# EAGLE board NanoBot-REV2 (EAGLE 9.6.2), part 1 of 2
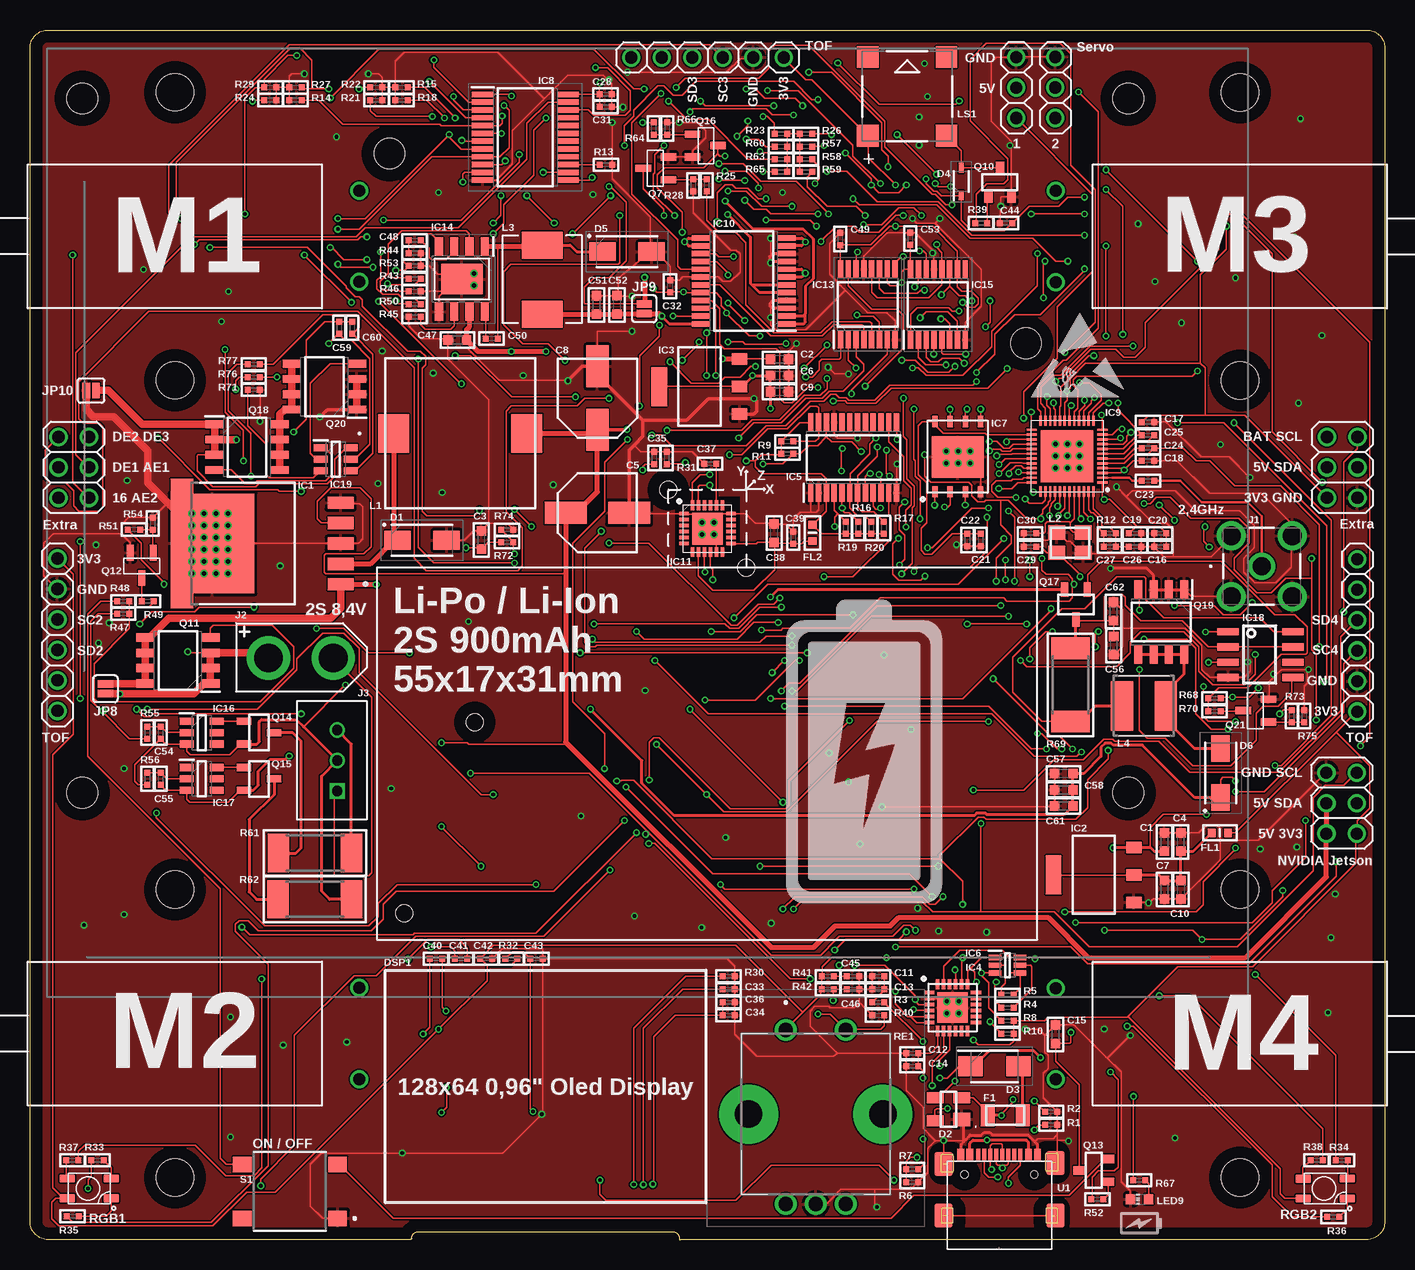
[diagram p3: board, top side]
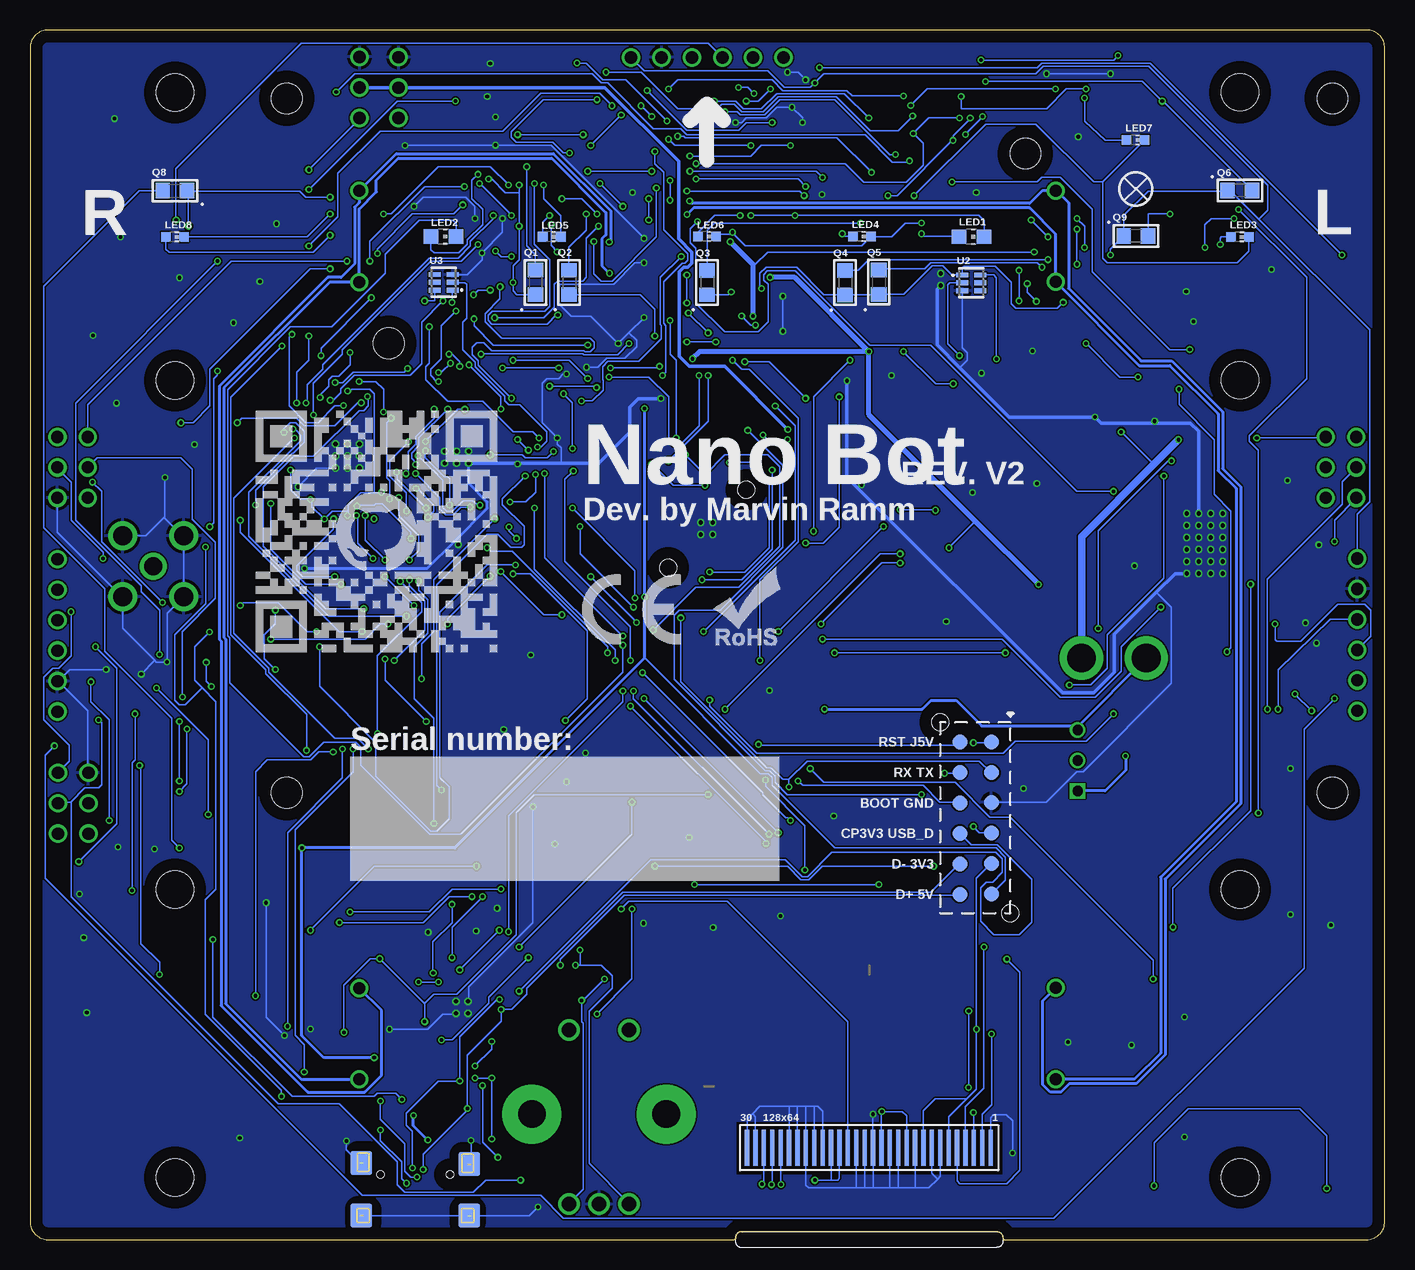
[diagram p4: board, bottom side, seen from below]

Size 112.9 x 100.8 mm. Coordinates in mm from the lower left corner, seen from the top.
Outline: 0,1.5 0,99.3 arc-90 1.5,100.8 111.4,100.8 arc-90 112.9,99.3 112.9,1.5 arc-90 111.4,0 54.2,0 arc-90 54.1,0.1 54.1,0.15 arc90 53.6,0.65 32.35,0.65 arc90 31.8,0.1 arc-90 31.7,0 1.5,0 arc-90 0,1.5
Copper layers (1*16): Top 0.035mm / dielectric 1.53mm / Bottom 0.035mm
Design rules "JLCPCB_1-2layer": minimum track width 5mil, minimum drill 0.3mm, track to track 5mil, track to pad 0.2mm, pad to pad 7mil, via to via 7mil, smd to smd 7mil, copper to edge 40mil, drill to drill 6mil, minimum pad ring 6mil, minimum via ring 0.13mm, stop-mask expansion 0.1mm, vias tented up to drill 20mil, thermal gap 10mil
Holes 2.55 mm at 29.95,90.5 83,74.7
Holes 1.4 mm at 59.7,56 53.2,62.5 37.05,43.1 31.2,27.2
tRestrict: area 53.8,56.5 to 59.2,61.9; area 83.5,62.6 to 89.3,68; area 62.2,81.2 to 63.8,82.4; area 62.2,77.4 to 63.8,78.5; area 65.1,62 to 65.7,62.5; area 48.2,94.7 to 48.7,95.2; area 20.4,94.8 to 21.6,96.2; area 20.4,95 to 21.8,96.2; area 29.2,95.1 to 29.6,96; area 30.2,95.1 to 30.6,95.9; area 29.3,95.9 to 30.3,96.2; area 29.5,94.8 to 30.2,95.2; 2 more areas
bRestrict: area 31.9,5.4 to 54,9.8
vRestrict: area 53.2,56 to 59.8,62.5

## Footprints (pad centres in the part's own frame; a part is rotated, then mirrored left to right if it is on the bottom)
C0603 = smd 0.8 x 0.8: 1 -0.762,0; 2 0.762,0
CAPAE660X800N = smd 3.5 x 1.85: 1 -2.65,0; 2 2.65,0
C0402 = smd 0.5 x 0.5: 1 -0.508,0; 2 0.508,0
DIOM5026X262N = smd 2.2 x 1.55: 1 -2.05,0; 2 2.05,0
SP0503BAHTG = smd 1.1 x 1.4: 1 -0.85,-1.1 | smd 0.9 x 1.4: 2 0.95,-1.1; 3 0.95,1.1; 4 -0.95,1.1
SODFL5026X120N = smd 2.02 x 1.67: 1 -2,0; 2 2,0
SODFL2512X90N = smd 0.82 x 0.42: 1 -1.15,0; 2 1.15,0
2864KSWE_128X64I2C = smd 0.35 x 3: D1 0.175,1.5; D2 0.875,1.5; D3 1.575,1.5; D4 2.275,1.5; D5 2.975,1.5; D6 3.675,1.5; D7 4.375,1.5; D8 5.075,1.5; D9 5.775,1.5; D10 6.475,1.5; D11 7.175,1.5; D12 7.875,1.5; D13 8.575,1.5; D14 9.275,1.5; D15 9.975,1.5; D16 10.675,1.5; D17 11.375,1.5; D18 12.075,1.5; D19 12.775,1.5; D20 13.475,1.5; D21 14.175,1.5; D22 14.875,1.5; D23 15.575,1.5; D24 16.275,1.5; D25 16.975,1.5; D26 17.675,1.5; D27 18.375,1.5; D28 19.075,1.5; D29 19.775,1.5; D30 20.475,1.5
FUSC3216X82N = smd 1.16 x 1.81: 1 -1.475,0; 2 1.475,0
BLM18AG102BH1D = smd 0.65 x 0.7: 1 -0.675,0; 2 0.675,0
KTT0005B = smd 2.16 x 1.02: 1 12.461,-3.4; 2 12.461,-1.7; 3 12.461,0; 4 12.461,1.7; 5 12.461,3.4 | smd 6.99 x 8.33: 6 1.786,0 | smd 1.91 x 1.235: 7 -0.754,4.782; 8 -0.754,-4.782
SOT229P700X180-4N = smd 1.3 x 0.95: 1 -3.35,2.29; 2 -3.35,0; 3 -3.35,-2.29 | smd 1.3 x 3.25: 4 3.35,0
QFN50P400X400X80-25N = smd 0.85 x 0.3: 1 -1.95,1.25; 2 -1.95,0.75; 3 -1.95,0.25; 4 -1.95,-0.25; 5 -1.95,-0.75; 6 -1.95,-1.25; 13 1.95,-1.25; 14 1.95,-0.75; 15 1.95,-0.25; 16 1.95,0.25; 17 1.95,0.75; 18 1.95,1.25 | smd 0.3 x 0.85: 7 -1.25,-1.95; 8 -0.75,-1.95; 9 -0.25,-1.95; 10 0.25,-1.95; 11 0.75,-1.95; 12 1.25,-1.95; 19 1.25,1.95; 20 0.75,1.95; 21 0.25,1.95; 22 -0.25,1.95; 23 -0.75,1.95; 24 -1.25,1.95 | smd 2.55 x 2.55: 25 0,0
SOP65P640X120-24N = smd 1.475 x 0.45: 1 -2.938,3.575; 2 -2.938,2.925; 3 -2.938,2.275; 4 -2.938,1.625; 5 -2.938,0.975; 6 -2.938,0.325; 7 -2.938,-0.325; 8 -2.938,-0.975; 9 -2.938,-1.625; 10 -2.938,-2.275; 11 -2.938,-2.925; 12 -2.938,-3.575; 13 2.938,-3.575; 14 2.938,-2.925; 15 2.938,-2.275; 16 2.938,-1.625; 17 2.938,-0.975; 18 2.938,-0.325; 19 2.938,0.325; 20 2.938,0.975; 21 2.938,1.625; 22 2.938,2.275; 23 2.938,2.925; 24 2.938,3.575
SOT65P230X120-6N = smd 1.05 x 0.45: 1 -1.05,0.65; 2 -1.05,0; 3 -1.05,-0.65; 4 1.05,-0.65; 5 1.05,0; 6 1.05,0.65
SON127P800X600X80-9N = smd 0.95 x 0.45: 1 -2.85,1.905; 2 -2.85,0.635; 3 -2.85,-0.635; 4 -2.85,-1.905; 5 3,-1.905; 6 3,-0.635; 7 3,0.635; 8 3,1.905 | smd 3.45 x 4.35: 9 0.05,0
SOP65P780X200-24N = smd 1.8 x 0.45: 1 -3.55,3.575; 2 -3.55,2.925; 3 -3.55,2.275; 4 -3.55,1.625; 5 -3.55,0.975; 6 -3.55,0.325; 7 -3.55,-0.325; 8 -3.55,-0.975; 9 -3.55,-1.625; 10 -3.55,-2.275; 11 -3.55,-2.925; 12 -3.55,-3.575; 13 3.55,-3.575; 14 3.55,-2.925; 15 3.55,-2.275; 16 3.55,-1.625; 17 3.55,-0.975; 18 3.55,-0.325; 19 3.55,0.325; 20 3.55,0.975; 21 3.55,1.625; 22 3.55,2.275; 23 3.55,2.925; 24 3.55,3.575
QFN40P600X600X90-49N = smd 0.85 x 0.2: 1 -2.95,2.2; 2 -2.95,1.8; 3 -2.95,1.4; 4 -2.95,1; 5 -2.95,0.6; 6 -2.95,0.2; 7 -2.95,-0.2; 8 -2.95,-0.6; 9 -2.95,-1; 10 -2.95,-1.4; 11 -2.95,-1.8; 12 -2.95,-2.2; 25 2.95,-2.2; 26 2.95,-1.8; 27 2.95,-1.4; 28 2.95,-1; 29 2.95,-0.6; 30 2.95,-0.2; 31 2.95,0.2; 32 2.95,0.6; 33 2.95,1; 34 2.95,1.4; 35 2.95,1.8; 36 2.95,2.2 | smd 0.2 x 0.85: 13 -2.2,-2.95; 14 -1.8,-2.95; 15 -1.4,-2.95; 16 -1,-2.95; 17 -0.6,-2.95; 18 -0.2,-2.95; 19 0.2,-2.95; 20 0.6,-2.95; 21 1,-2.95; 22 1.4,-2.95; 23 1.8,-2.95; 24 2.2,-2.95; 37 2.2,2.95; 38 1.8,2.95; 39 1.4,2.95; 40 1,2.95; 41 0.6,2.95; 42 0.2,2.95; 43 -0.2,2.95; 44 -0.6,2.95; 45 -1,2.95; 46 -1.4,2.95; 47 -1.8,2.95; 48 -2.2,2.95 | smd 4.35 x 4.35: 49 0,0
SOP65P760X160-24N = smd 1.525 x 0.45: 1 -3.562,3.575; 2 -3.562,2.925; 3 -3.562,2.275; 4 -3.562,1.625; 5 -3.562,0.975; 6 -3.562,0.325; 7 -3.562,-0.325; 8 -3.562,-0.975; 9 -3.562,-1.625; 10 -3.562,-2.275; 11 -3.562,-2.925; 12 -3.562,-3.575; 13 3.562,-3.575; 14 3.562,-2.925; 15 3.562,-2.275; 16 3.562,-1.625; 17 3.562,-0.975; 18 3.562,-0.325; 19 3.562,0.325; 20 3.562,0.975; 21 3.562,1.625; 22 3.562,2.275; 23 3.562,2.925; 24 3.562,3.575
QFN50P400X400X95-25N = smd 0.8 x 0.3: 1 -1.95,1.25; 2 -1.95,0.75; 3 -1.95,0.25; 4 -1.95,-0.25; 5 -1.95,-0.75; 6 -1.95,-1.25; 13 1.95,-1.25; 14 1.95,-0.75; 15 1.95,-0.25; 16 1.95,0.25; 17 1.95,0.75; 18 1.95,1.25 | smd 0.3 x 0.8: 7 -1.25,-1.95; 8 -0.75,-1.95; 9 -0.25,-1.95; 10 0.25,-1.95; 11 0.75,-1.95; 12 1.25,-1.95; 19 1.25,1.95; 20 0.75,1.95; 21 0.25,1.95; 22 -0.25,1.95; 23 -0.75,1.95; 24 -1.25,1.95 | smd 2.55 x 2.65: 25 0,0
SOP65P640X110-16N = smd 1.475 x 0.45: 1 -2.938,2.275; 2 -2.938,1.625; 3 -2.938,0.975; 4 -2.938,0.325; 5 -2.938,-0.325; 6 -2.938,-0.975; 7 -2.938,-1.625; 8 -2.938,-2.275; 9 2.938,-2.275; 10 2.938,-1.625; 11 2.938,-0.975; 12 2.938,-0.325; 13 2.938,0.325; 14 2.938,0.975; 15 2.938,1.625; 16 2.938,2.275
SOIC127P600X170-9N = smd 1.525 x 0.7: 1 -2.712,1.905; 2 -2.712,0.635; 3 -2.712,-0.635; 4 -2.712,-1.905; 5 2.712,-1.905; 6 2.712,-0.635; 7 2.712,0.635; 8 2.712,1.905 | smd 2.56 x 3.45: 9 0,0
SOT95P280X140-6N = smd 1.15 x 0.6: 1 -1.25,0.95; 2 -1.25,0; 3 -1.25,-0.95; 4 1.25,-0.95; 5 1.25,0; 6 1.25,0.95
CN3302 = smd 0.6 x 1.8: 1 0.49,-0.79; 2 1.76,-0.79; 3 3.03,-0.79; 4 4.3,-0.79; 5 4.3,4.61; 6 3.03,4.61; 7 1.76,4.61; 8 0.49,4.61
518148322 = drill 1.5 pad 2.25: 1 0,0 | drill 1.6 pad 2.4: 2 -2.54,-2.54; 3 2.54,-2.54; 4 2.54,2.54; 5 -2.54,2.54
XT_30 = drill 2.4 pad 3.6: B+ 0,0; GND 5.4,0
2SBALANCER = drill 0.85: 1S 2.64,0; 2S 5.18,0 | drill 0.85 square: GND 0.1,0
2X03 = drill 1.016: 1 -2.54,-1.27; 2 -2.54,1.27; 3 0,-1.27; 4 0,1.27; 5 2.54,-1.27; 6 2.54,1.27
1X06 = drill 1.016: 1 -6.35,0; 2 -3.81,0; 3 -1.27,0; 4 1.27,0; 5 3.81,0; 6 6.35,0
1X03 = drill 1.016: 1 -2.54,0; 2 0,0; 3 2.54,0
SMT-JUMPER_2_NO_SILK = smd 0.635 x 1.27: 1 -0.406,0; 2 0.406,0
SLF12575 = smd 2.6 x 3.2: 1 -5.55,0; 2 5.55,0
SMD3225_4P16MHZ20PF10PPM4085 = smd 1.4 x 1.2: 1 -1.1,-0.85; 2 1.1,-0.85; 3 1.1,0.85; 4 -1.1,0.85
MDA7050-4R7M = smd 2.25 x 3.4: 1 0.8,3.3; 2 6.55,3.3
LQH5BPB100MT0L = smd 1.85 x 4.1: 1 -1.825,0; 2 1.825,0
CHIP-LED0805 = smd 1.2 x 1.2: A 0,-1.05; C 0,1.05
CHIP-LED0603 = smd 0.8 x 0.8: A 0,-0.75; C 0,0.75
XDCR_CMT-7525-80-SMT-TR = smd 1.8 x 1.8: 1 3.275,3.275; 2 3.275,-3.275; N -3.275,-3.275; P -3.275,3.275
MOTOR_30RPM = drill 1: 1 2.2,3.1; 2 9.8,3.1 | hole 3.1: -6,-12.25; 18,-12.25
0805 = smd 1.2 x 1.3: 1 -1.016,0; 2 1.016,0
SOT95P237X112-3N = smd 1.3 x 0.6: 1 -1.05,0.95; 2 -1.05,-0.95; 3 1.05,0
SOT95P240X120-3N = smd 1 x 0.7: 1 -1.2,0.95; 2 -1.2,-0.95; 3 1.2,0
SOIC127P600X175-8N = smd 1.525 x 0.7: 1 -2.712,1.905; 2 -2.712,0.635; 3 -2.712,-0.635; 4 -2.712,-1.905; 5 2.712,-1.905; 6 2.712,-0.635; 7 2.712,0.635; 8 2.712,1.905
FSS2302SA2SHB = smd 1.2 x 0.6: D 1.25,0; G -1.25,0.95; S -1.25,-0.95
SOT95P280X125-3N = smd 1.2 x 0.6: 1 -1.25,0.95; 2 -1.25,-0.95; 3 1.25,0
SOIC127P600X175-8N' = smd 1.525 x 0.65: 1 -2.712,1.905; 2 -2.712,0.635; 3 -2.712,-0.635; 4 -2.712,-1.905; 5 2.712,-1.905; 6 2.712,-0.635; 7 2.712,0.635; 8 2.712,1.905
R0402 = smd 0.5 x 0.5: 1 -0.508,0; 2 0.508,0
R2512 = smd 1.8 x 3.2: 1 -3.048,0; 2 3.048,0
PEC12R4230FS0024 = drill 1.2 pad 1.8: 1 0,0; 2 5,0; A1 0,-14.5; B1 5,-14.5; C1 2.5,-14.5 | drill 2.3 pad 4.92: MH1 -3.1,-7; MH2 8.1,-7
RGBLED = smd 0.686 x 1.3: +5V -1.456,1.996; P1 0.184,1.996; P2 -1.458,-1.678; P3 0.192,-1.678
B3S1002P = smd 1.55 x 1.3: 1 3.975,-2.25; 2 -3.975,-2.25; 3 3.975,2.25; 4 -3.975,2.25
PAD.03X.05 = smd 1.27 x 1.27: 1 0,0
TYPE-C-31-M-14_HRO = smd 0.559 x 1.092: A1B12 -3.11,4; A4B9 -2.36,4; B1A12 3.29,4; B4A9 2.54,4 | smd 0.305 x 1.092: A5 -1.16,4; A6 -0.16,4; A7 0.34,4; A8 1.34,4; B5 1.84,4; B6 0.84,4; B7 -0.66,4; B8 -1.66,4 | smd 1.5 x 2 bottom: P$1 -4.24,3.26; P$2 4.46,3.36; P$3 -4.44,3.26; P$4 4.66,3.36; P$5 -4.24,-1.04; P$6 -4.44,-1.04; P$7 4.46,-1.04; P$8 4.66,-1.04; P$9 -4.54,3.26; P$10 -4.54,-1.04; P$11 4.76,-1.04; P$12 4.76,3.36 | smd 1.5 x 2: P$14 -4.54,3.26; P$16 -4.54,-1.04; P$18 4.76,3.36; P$20 4.76,-1.04 | hole 0.6: -2.79,2.39; 3.01,2.39
FN_1 = smd 1 x 0.4: 1 -0.75,0.65; 2 -0.75,0; 3 -0.75,-0.65; 4 0.75,-0.65; 5 0.75,0; 6 0.75,0.65
JETSON_NANO = hole 2.55: 2.95,-4.15; 90.1,-4.15; 2.95,-62; 90.1,-62

## Placement (x,y rotation side)
C1  4,7µF  [C0603]  94.54,33.13 90 top
C2  4,7µF  [C0603]  62.46,73.36 0 top
C3  10µF  [C0603]  37.61,58.3 270 top
C4  10µF  [C0603]  95.9,33.13 90 top
C5  UUD1C151MCL1GS  [CAPAE660X800N]  47.28,60.56 0 top
C6  10µF  [C0603]  62.46,72 0 top
C7  10µF  [C0603]  94.55,29.16 270 top
C8  UUD1C151MCL1GS  [CAPAE660X800N]  47.29,70.12 90 top
C9  10µF  [C0603]  62.46,70.65 0 top
C10  10µF  [C0603]  95.91,29.16 270 top
C11  0,1uF  [C0402]  70.68,21.94 0 top
C12  0,1uF  [C0402]  73.52,15.54 0 top
C13  4,7uF  [C0402]  70.67,20.85 0 top
C14  4,7uF  [C0402]  73.52,14.44 0 top
C15  10µF  [C0603]  85.46,17.11 270 top
C16  100pF  [C0402]  94.18,57.75 0 top
C17  0,1uF  [C0402]  93.16,68.13 180 top
C18  0,1uF  [C0402]  93.16,64.9 180 top
C19  0,1uF  [C0402]  92.09,58.86 180 top
C20  0,1uF  [C0402]  94.18,58.86 0 top
C21  1uF  [C0402]  79.23,58.3 90 top
C22  0,1uF  [C0402]  78.12,58.3 90 top
C23  5,6pF  [C0402]  93.16,63.24 0 top
C24  270pF  [C0402]  93.16,65.96 180 top
C25  270pF  [C0402]  93.16,67.04 0 top
C26  10nF  [C0402]  92.09,57.75 180 top
C27  3nF  [C0402]  89.98,57.75 180 top
C28  0,1µF  [C0402]  47.97,95.44 0 top
C29  12pF  [C0402]  83.33,57.74 0 top
C30  12pF  [C0402]  83.33,58.85 0 top
C31  1uF  [C0402]  47.97,94.39 180 top
C32  100nF  [C0402]  53.34,79.45 90 top
C33  1µF  [C0402]  58.22,20.87 180 top
C34  1µF  [C0402]  58.22,18.69 180 top
C35  100nF  [C0402]  52.03,65.13 270 top
C36  1µF  [C0402]  58.22,19.78 180 top
C37  10nF  [C0402]  56.68,64.66 180 top
C38  10µF  [C0603]  62.01,58.87 270 top
C39  1uF  [C0402]  63.6,58.5 90 top
C40  1µF  [C0402]  33.84,23.4 0 top
C41  1µF  [C0402]  35.92,23.4 0 top
C42  1µF  [C0402]  38.01,23.4 0 top
C43  1µF  [C0402]  42.21,23.4 0 top
C44  1uF  [C0402]  81.34,84.71 180 top
C45  10nF  [C0402]  68.59,21.94 0 top
C46  10nF  [C0402]  68.59,20.85 0 top
C47  10µF  [C0603]  35.62,74.96 0 top
C48  100pF  [C0402]  32.05,83.29 0 top
C49  0,1µF  [C0402]  67.51,83.38 90 top
C50  0,1µF  [C0402]  38.47,75.09 0 top
C51  10µF  [C0603]  47.21,77.89 270 top
C52  10µF  [C0603]  48.91,77.9 270 top
C53  0,1µF  [C0402]  73.36,83.41 90 top
C54  100nF  [C0402]  10.89,42.25 270 top
C55  100nF  [C0402]  10.89,38.4 270 top
C56  10µF  [C0603]  90.31,49.51 270 top
C57  10µF  [C0603]  86.14,38.83 180 top
C58  10µF  [C0603]  86.14,37.48 180 top
C59  0,1µF  [C0402]  25.77,75.99 90 top
C60  0,1µF  [C0402]  26.86,75.99 90 top
C61  10µF  [C0603]  86.14,36.14 180 top
C62  10µF  [C0603]  90.3,52.35 90 top
D1  SS34A  [DIOM5026X262N]  32.67,58.28 0 top
D2  SP0503BAHTG  [SP0503BAHTG]  76.54,10.86 90 top
D3  SK53AFL-TP  [SODFL5026X120N]  80.37,14.43 0 top
D4  1N4148WS  [SODFL2512X90N]  77.6,88.16 90 top
D5  SS34A  [DIOM5026X262N]  49.75,82.33 0 top
D6  SS34A  [DIOM5026X262N]  99.22,38.88 90 top
DSP1  2864KSWE_128X64I2C  [2864KSWE_128X64I2C]  53.32,6.16 0 bottom
F1  NANOSMDC020F-2  [FUSC3216X82N]  81.27,10.36 0 top
FL1  BLM18PG121SN1D  [BLM18AG102BH1D]  99.15,33.9 180 top
FL2  BLM18PG121SN1D  [BLM18AG102BH1D]  65.2,58.89 270 top
IC1  LM2576S-5.0  [KTT0005B]  13.42,58.01 0 top
IC2  AMS1117-3.3  [SOT229P700X180-4N]  88.64,30.39 180 top
IC3  AMS1117-3.3  [SOT229P700X180-4N]  55.79,71.09 180 top
IC4  CP2102N-A02-GQFN24R  [QFN50P400X400X80-25N]  76.89,19.34 0 top
IC5  TCA9548APWR  [SOP65P640X120-24N]  68.64,65.18 90 top
IC6  MMDT3904-TP  [SOT65P230X120-6N]  81.46,22.86 0 top
IC7  W25Q128JVPIQ  [SON127P800X600X80-9N]  77.31,65.17 90 top
IC8  CD74HC4067SM96  [SOP65P780X200-24N]  41.28,91.86 0 top
IC9  ESP32-D0WDQ6  [QFN40P600X600X90-49N]  86.42,65.29 180 top
IC10  TB6612FNG,C,8,EL  [SOP65P760X160-24N]  59.48,79.89 180 top
IC11  MPU-6050  [QFN50P400X400X95-25N]  56.45,59.25 0 top
IC13  74HC595PW,118  [SOP65P640X110-16N]  69.81,77.94 90 top
IC14  MP1584EN-LF-Z  [SOIC127P600X170-9N]  35.99,80.05 270 top
IC15  74HC595PW,118  [SOP65P640X110-16N]  75.66,77.93 90 top
IC16  HY2213-BB3A  [SOT95P280X140-6N]  14.3,42.25 0 top
IC17  HY2213-BB3A  [SOT95P280X140-6N]  14.3,38.4 0 top
IC18  CN3302  [CN3302]  100.63,51.15 270 top
IC19  HY2120-CB  [SOT95P280X140-6N]  25.47,65.03 0 top
J1  5-1814832-2  [518148322]  102.64,56.11 0 top
J2  XT_30  [XT_30]  19.87,48.47 0 top
J3  2SBALANCER  [2SBALANCER]  25.6,37.29 90 top
JP1  [2X03]  109.3,36.37 270 top
JP2  [1X06]  2.29,50.41 90 top
JP3  [1X06]  56.46,98.51 0 top
JP4  [1X06]  110.61,50.35 270 top
JP5  [1X03]  82.19,96 90 top
JP6  [1X03]  85.44,96.01 90 top
JP8  JUMPER-SMT_2_NO_SILK  [SMT-JUMPER_2_NO_SILK]  6.29,45.9 90 top
JP9  JUMPER-SMT_2_NO_SILK  [SMT-JUMPER_2_NO_SILK]  51.19,77.57 90 top
JP10  JUMPER-SMT_2_NO_SILK  [SMT-JUMPER_2_NO_SILK]  5.09,70.76 0 top
JP11  [2X03]  109.35,64.35 270 top
JP12  [2X03]  3.65,64.35 270 top
L1  SLF12575T-101M1R9-PF  [SLF12575]  35.85,67.18 0 top
L2  SMD-3225_4P16MHZ_20PF_10PPM_-4  [SMD3225_4P16MHZ20PF10PPM4085]  86.66,58.09 0 top
L3  MDA7050-4R7M  [MDA7050-4R7M]  39.38,83.68 270 top
L4  LQH5BPB100MT0L  [LQH5BPB100MT0L]  92.82,44.47 0 top
LED1  [CHIP-LED0805]  34.45,83.57 270 bottom
LED2  [CHIP-LED0805]  78.45,83.58 270 bottom
LED3  SZYY0603W  [CHIP-LED0603]  12.07,83.56 270 bottom
LED4  SZYY0603W  [CHIP-LED0603]  43.57,83.59 270 bottom
LED5  SZYY0603W  [CHIP-LED0603]  69.42,83.57 270 bottom
LED6  SZYY0603W  [CHIP-LED0603]  56.47,83.6 270 bottom
LED7  SZYY0603W  [CHIP-LED0603]  20.77,91.63 270 bottom
LED8  SZYY0603W  [CHIP-LED0603]  100.82,83.56 270 bottom
LED9  SZYY0603W  [CHIP-LED0603]  92.47,3.36 90 top
LS1  CMT-7525-80-SMT-TR  [XDCR_CMT-7525-80-SMT-TR]  73.09,95.26 90 top
M1  MOTOR_30RPM  [MOTOR_30RPM]  24.33,23.17 270 top
M2  MOTOR_30RPM  [MOTOR_30RPM]  24.33,89.61 270 top
M3  MOTOR_30RPM  [MOTOR_30RPM]  88.57,77.6 90 top
M4  MOTOR_30RPM  [MOTOR_30RPM]  88.57,11.16 90 top
Q1  PT17-21C/L41/TR8  [0805]  70.77,79.77 270 bottom
Q2  PT17-21C/L41/TR8  [0805]  67.97,79.76 270 bottom
Q3  PT17-21C/L41/TR8  [0805]  56.47,79.75 270 bottom
Q4  PT17-21C/L41/TR8  [0805]  44.97,79.74 270 bottom
Q5  PT17-21C/L41/TR8  [0805]  42.17,79.78 270 bottom
Q6  PT17-21C/L41/TR8  [0805]  12.08,87.42 180 bottom
Q7  SI2302DDS-T1-GE3  [SOT95P237X112-3N]  52.15,89.27 180 top
Q8  PT17-21C/L41/TR8  [0805]  100.82,87.41 0 bottom
Q9  PT17-21C/L41/TR8  [0805]  20.74,83.64 180 bottom
Q10  MMBT3904  [SOT95P240X120-3N]  80.83,88.11 90 top
Q11  IRF7416TRPBF  [SOIC127P600X175-8N]  12.32,48.26 180 top
Q12  SI2302DDS-T1-GE3  [SOT95P237X112-3N]  9.31,56.19 270 top
Q13  MMBT3904  [SOT95P240X120-3N]  88.64,5.77 180 top
Q14  FSS2302SA2SHB  [FSS2302SA2SHB]  19.09,42.25 0 top
Q15  FSS2302SA2SHB  [FSS2302SA2SHB]  19.09,38.4 0 top
Q16  SI2302DDS-T1-GE3  [SOT95P237X112-3N]  56.27,91.17 0 top
Q17  AO3407A  [SOT95P280X125-3N]  87.16,52.92 270 top
Q18  AO4406AL  [SOIC127P600X175-8N']  18.09,66.04 0 top
Q19  AO4468  [SOIC127P600X175-8N']  94.27,51.46 270 top
Q20  AO4406AL  [SOIC127P600X175-8N']  24.53,71.08 180 top
Q21  SI2302DDS-T1-GE3  [SOT95P237X112-3N]  102.15,44.09 180 top
R1  5,1kΩ  [R0402]  85.1,9.57 0 top
R2  5,1kΩ  [R0402]  85.1,10.65 0 top
R3  2,2kΩ  [R0402]  70.67,19.77 0 top
R4  10kΩ  [R0402]  81.46,19.33 0 top
R5  10kΩ  [R0402]  81.46,20.41 0 top
R6  33kΩ  [R0402]  73.52,4.79 0 top
R7  22kΩ  [R0402]  73.52,5.88 180 top
R8  10kΩ  [R0402]  81.46,18.24 180 top
R9  10kΩ  [R0402]  63.11,66.51 180 top
R10  10kΩ  [R0402]  81.46,17.16 0 top
R11  10kΩ  [R0402]  63.11,65.48 180 top
R12  20kΩ  [R0402]  89.98,58.86 0 top
R13  10kΩ  [R0402]  48,89.57 0 top
R14  5,1kΩ  [R0402]  22.12,94.96 180 top
R15  5,1kΩ  [R0402]  30.96,96.01 180 top
R16  10kΩ  [R0402]  69.03,59.31 90 top
R17  10kΩ  [R0402]  71.16,59.31 90 top
R18  5,1kΩ  [R0402]  30.96,94.94 180 top
R19  10kΩ  [R0402]  67.97,59.31 270 top
R20  10kΩ  [R0402]  70.1,59.31 270 top
R21  5,1kΩ  [R0402]  28.86,94.94 0 top
R22  5,1kΩ  [R0402]  28.86,96.01 0 top
R23  100Ω  [R0402]  62.58,92.15 180 top
R24  5,1kΩ  [R0402]  20.03,94.96 0 top
R25  1kΩ  [R0402]  56.39,87.86 90 top
R26  100Ω  [R0402]  64.67,92.15 0 top
R27  5,1kΩ  [R0402]  22.12,96.01 180 top
R28  100kΩ  [R0402]  55.27,87.85 270 top
R29  2,2kΩ  [R0402]  20.03,96.01 0 top
R30  390kΩ  [R0402]  58.22,21.95 0 top
R31  10kΩ  [R0402]  53.07,65.13 270 top
R32  10kΩ  [R0402]  40.11,23.4 0 top
R33  2,2kΩ  [R0402]  5.63,6.61 180 top
R34  2,2kΩ  [R0402]  109.32,6.61 180 top
R35  2,2kΩ  [R0402]  3.55,1.94 180 top
R36  2,2kΩ  [R0402]  108.61,1.89 180 top
R37  2,2kΩ  [R0402]  3.53,6.61 0 top
R38  2,2kΩ  [R0402]  107.22,6.61 0 top
R39  1kΩ  [R0402]  79.26,84.71 0 top
R40  10kΩ  [R0402]  70.67,18.68 0 top
R41  10kΩ  [R0402]  66.49,21.94 0 top
R42  10kΩ  [R0402]  66.49,20.85 0 top
R43  100kΩ  [R0402]  32.05,80.08 0 top
R44  100kΩ  [R0402]  32.05,82.21 0 top
R45  100kΩ  [R0402]  32.05,76.89 180 top
R46  100kΩ  [R0402]  32.05,79.01 180 top
R47  100kΩ  [R0402]  7.77,52.15 0 top
R48  1kΩ  [R0402]  7.77,53.2 180 top
R49  1kΩ  [R0402]  9.82,53.2 180 top
R50  10kΩ  [R0402]  32.05,77.95 0 top
R51  1kΩ  [R0402]  8.66,59.17 0 top
R52  1kΩ  [R0402]  88.95,3.37 0 top
R53  75kΩ  [R0402]  32.05,81.15 180 top
R54  100kΩ  [R0402]  10.23,59.66 90 top
R55  100Ω  [R0402]  9.79,42.25 90 top
R56  100Ω  [R0402]  9.79,38.4 90 top
R57  100Ω  [R0402]  64.67,91.09 0 top
R58  100Ω  [R0402]  64.67,90.03 0 top
R59  100Ω  [R0402]  64.67,88.97 0 top
R60  100Ω  [R0402]  62.58,91.09 180 top
R61  62Ω  [R2512]  23.74,32.21 0 top
R62  62Ω  [R2512]  23.73,28.36 0 top
R63  100Ω  [R0402]  62.58,90.03 180 top
R64  1kΩ  [R0402]  51.99,92.59 270 top
R65  100Ω  [R0402]  62.58,88.97 180 top
R66  100kΩ  [R0402]  53.11,92.59 90 top
R67  2,2kΩ  [R0402]  92.44,4.94 180 top
R68  100kΩ  [R0402]  98.71,45.1 180 top
R69  0,1Ω  [R2512]  86.71,46.23 270 top
R70  1kΩ  [R0402]  98.71,44.04 0 top
R71  2,2kΩ  [R0402]  18.65,70.81 0 top
R72  100kΩ  [R0402]  39.76,58.11 0 top
R73  1kΩ  [R0402]  105.15,43.62 270 top
R74  64,9kΩ  [R0402]  39.76,59.16 0 top
R75  100kΩ  [R0402]  106.2,43.62 90 top
R76  330Ω  [R0402]  18.65,71.87 0 top
R77  330Ω  [R0402]  18.65,72.95 180 top
RE1  PEC12R-4230F-S0024  [PEC12R4230FS0024]  62.98,17.46 0 top
RGB1  RGBLED  [RGBLED]  5.09,4.9 90 top
RGB2  RGBLED  [RGBLED]  108.09,4.89 90 top
S1  B3S-1002P  [B3S1002P]  21.66,4.02 0 top
TP1  TEST-POINT3X5  [PAD.03X.05]  32.78,28.82 270 bottom
TP2  TEST-POINT3X5  [PAD.03X.05]  32.78,31.36 270 bottom
TP3  TEST-POINT3X5  [PAD.03X.05]  32.78,33.9 270 bottom
TP4  TEST-POINT3X5  [PAD.03X.05]  32.78,36.44 270 bottom
TP5  TEST-POINT3X5  [PAD.03X.05]  35.42,28.77 270 bottom
TP6  TEST-POINT3X5  [PAD.03X.05]  35.42,31.31 270 bottom
TP7  TEST-POINT3X5  [PAD.03X.05]  35.42,33.85 270 bottom
TP8  TEST-POINT3X5  [PAD.03X.05]  35.42,36.39 270 bottom
TP9  TEST-POINT3X5  [PAD.03X.05]  35.42,38.93 270 bottom
TP10  TEST-POINT3X5  [PAD.03X.05]  35.42,41.47 270 bottom
TP11  TEST-POINT3X5  [PAD.03X.05]  32.77,38.91 270 bottom
TP12  TEST-POINT3X5  [PAD.03X.05]  32.77,41.45 270 bottom
U1  TYPE-C-31-M-14  [TYPE-C-31-M-14_HRO]  80.68,3.04 0 top
U2  TCS34725FN  [FN_1]  34.46,79.73 0 bottom
U3  TCS34725FN  [FN_1]  78.44,79.77 180 bottom
U$3  JETSON_NANO  [JETSON_NANO]  1.41,99.25 0 top

## Tracks (layer width: path | path; a pad name or v marks a point on that pad's centre or on a via)
0-BOOT  (via drill 0.3)
  Top 0.127: R8.2 80.9,18.29 79.88,19.3 79.88,21.41 79.3,22 v79.3,22.22 IC6.3 | v48.9,38.23 49.28,38.23 49.31,38.26 50.32,38.26 56.83,31.75 75.83,31.75 | v77.72,27.94 77.72,29.85 75.83,31.75 | IC9.23 84.62,69.28 84.22,69.68 84.22,71.02 85.25,72.04 85.89,72.04 88.3,74.46 v91.91,74.46 | v89.85,40.77 89.85,40.06 88.13,38.34 88.13,35.99 87.16,35.02 79.67,35.02 79.47,35.22 79.02,35.22 75.83,32.02 75.83,31.75
  Bottom 0.127: v48.9,38.23 48.51,37.85 38.48,37.85 37.08,36.45 35.43,36.45 TP8.1 | v77.72,27.94 77.72,26.42 79.33,24.8 79.33,22.26 v79.3,22.22 | v89.85,40.77 89.85,43.76 93.25,47.17 93.25,47.49 96.17,50.41 96.17,70.19 v91.91,74.46
2-P_ON  (via drill 0.3)
  Top 0.127: v84.77,70.26 84.77,69.98 84.75,69.96 84.75,69.51 85.02,69.24 IC9.22 | R51.1 8.14,59.14 9.25,58.04 9.25,56.67 11.12,54.81 11.12,54.67 v11.18,54.61 | v17.65,26.04 17.68,26.04 18.3,25.42 31.94,25.42 32.04,25.52 42.16,25.52 v50.55,33.91 | v61.72,45.09 77.72,45.09 85.09,52.45 v85.09,52.58
  Bottom 0.127: v11.18,54.61 11.18,35.74 17.65,29.26 v17.65,26.04 | v61.72,45.09 v50.55,33.91 | v85.09,52.58 88.27,52.58 93.47,57.78 93.47,62.74 90.93,65.28 89.28,65.28 85.47,69.09 85.09,69.09 84.71,69.47 84.71,70.23 v84.77,70.26
4-S0  (via drill 0.3)
  Top 0.127: IC9.24 84.22,68.99 83.97,69.24 83.97,71.13 86.12,73.28 86.37,73.28 89.03,75.94 89.03,93.98 v87.38,95.63 | v39.61,89.9 39.61,89.84 39.33,89.56 37.75,89.56 IC8.10
  Bottom 0.127: v87.38,95.63 85.85,97.16 66.04,97.16 65.28,96.39 64.77,96.39 60.96,92.58 58.67,92.58 58.17,92.08 43.31,92.08 41.03,89.8 39.71,89.8 v39.61,89.9
5-S1  (via drill 0.3)
  Top 0.127: IC9.34 82.44,63.89 v82.37,63.96 | v79.88,60.96 78.49,60.96 75.18,57.66 v74.8,57.66 | v45.85,48.9 v64.77,48.9 | v31.62,48.9 28.19,48.9 26.16,50.93 v23.88,50.93 | v17.78,64.9 17.78,67.44 16.26,68.96 v16.26,74.17 | v36.07,88.14 36.07,88.78 36.24,88.95 37.72,88.95 IC8.11
  Bottom 0.127: v79.88,60.96 82.3,63.37 82.3,63.88 v82.37,63.96 | v74.8,57.66 74.51,57.37 72.72,57.37 64.77,49.42 v64.77,48.9 | v31.62,48.9 v45.85,48.9 | v23.88,50.93 23.88,59.05 18.03,64.9 v17.78,64.9 | v16.26,74.17 17.92,74.17 24.38,80.64 24.38,85.85 27.05,88.52 28.57,88.52 28.96,88.14 v36.07,88.14
12-S2  (via drill 0.3)
  Top 0.127: v86.77,69.51 86.62,69.36 IC9.18 | v91.06,75.44 91.06,86.11 v89.66,87.5 | v77.44,94.88 77.16,94.6 70.75,94.6 v67.31,98.04 | v59.82,93.22 59.82,92.84 v58.93,91.95 | v42.77,88.94 IC8.14
  Bottom 0.127: v91.06,75.44 91.31,75.18 91.31,69.47 89.92,68.07 88.9,68.07 87.5,69.47 86.87,69.47 v86.77,69.51 | v89.66,87.5 82.29,94.88 v77.44,94.88 | v67.31,98.04 66.55,98.04 65.15,96.65 63.25,96.65 v59.82,93.22 | v58.93,91.95 58.42,91.95 58.29,91.82 45.66,91.82 v42.77,88.94
13-S3  (via drill 0.3)
  Top 0.127: IC9.20 85.82,69.42 85.88,69.48 85.88,71.02 86.42,71.56 86.42,71.86 88.22,73.66 v88.65,73.66 | v84.45,78.49 84.45,81.41 v84.58,81.53 | v76.71,87.76 75.69,87.76 v75.44,88.01 | v72.77,85.34 72.14,85.34 70.74,83.95 69.1,83.95 68.59,84.45 67.18,84.45 v65.91,83.19 | v60.71,87.63 60.71,88.01 59.69,89.03 v57.91,89.03 | v46.85,88.51 46.62,88.28 IC8.13
  Bottom 0.127: v88.65,73.66 88.65,74.3 v84.45,78.49 | v72.77,85.34 v75.44,88.01 | v65.91,83.19 65.91,80.49 65.31,79.88 64.39,79.88 60.71,83.57 v60.71,87.63 | v57.91,89.03 47.36,89.03 v46.85,88.51 | v76.71,87.76 80.02,87.76 84.58,83.19 v84.58,81.53
14-CHARGE_STAT  (via drill 0.3)
  Top 0.127: IC9.17 87.02,68.99 87.31,69.28 87.31,70.81 86.93,71.2 86.93,71.65 87.25,71.97 96.86,71.97 v97.28,72.39 | v91.95,11.94 91.95,4.95 R67.2 | v97.92,59.4 97.79,59.27 97.79,58.19 v98.27,57.71 | IC18.1 97.98,50.66 v97.95,50.63
  Bottom 0.127: v91.95,11.94 91.95,12.45 98.3,18.8 98.3,28.32 97.41,29.21 97.41,44.83 98.55,45.97 | 98.55,45.97 99.19,46.61 99.19,49.39 v97.95,50.63 | v97.28,72.39 97.28,72.01 97.57,71.72 97.57,59.75 v97.92,59.4 | v98.27,57.71 98.27,52.98 100.84,50.42 100.84,44.96 100.46,44.58 99.95,44.58 98.55,45.97
15-ENC_SW  (via drill 0.3)
  Top 0.127: v85.29,69.74 85.29,69.29 85.42,69.16 IC9.21 | R40.2 71.18,17.81 70.9,17.53 68.07,17.53 RE1.2 67.94,17.53 66.67,18.8 v65.66,18.8 | v95.63,68.07 99.5,68.07 108.08,59.49 108.08,46.74 v107.82,46.48 | v106.3,34.92 106.3,31.88 103.5,29.08 103.5,28.07 101.85,26.42 v87.12,26.42 | v76.07,28.57 75.44,27.94 74.98,27.94 74.38,28.54 63.72,28.54 v62.74,27.56
  Bottom 0.127: v95.63,68.07 95.25,68.45 90.68,68.45 90.04,67.82 87.5,67.82 85.6,69.72 85.34,69.72 v85.29,69.74 | v107.82,46.48 107.82,44.83 106.3,43.31 v106.3,34.92 | v87.12,26.42 80.14,26.42 77.98,28.57 v76.07,28.57 | v62.74,27.56 62.74,21.72 v65.66,18.8
16  (via drill 0.3)
  Top 0.127: v83.44,68.96 83.44,67.56 IC9.25 | v4.19,58.17 v4.19,45.09 | v110.87,41.15 111.64,41.92 111.64,74.8 100.94,85.51 99.98,85.51 99.06,84.59 99.06,82.54 92.93,76.42 92.93,74.38 92.09,73.54 91.14,73.54 90.47,74.2 88.4,74.2 85.99,71.79 85.76,71.79 v85.47,71.5
  Bottom 0.127: v110.87,41.15 110.87,41.11 111.63,40.35 111.63,30.1 85.22,3.68 70.36,3.68 68.45,1.78 27.57,1.78 6.73,22.62 6.73,42.55 v4.19,45.09 | v4.19,58.17 4.19,59.94 2.41,61.72 JP12.5 | v85.47,71.5 84.07,71.5 83.44,70.87 v83.44,68.96
17-EN_RST  (via drill 0.3)
  Top 0.127: IC9.27 81.58,66.69 v81.37,66.48 | v90.04,13.97 90.68,13.34 90.68,6.03 90.37,5.73 89.03,5.73 88.52,5.22 88.52,3.43 R52.1 | v85.98,40.89 85.6,40.89 84.33,42.16 v83.95,42.16 | v82.04,54.86 82.04,60.2 v81.53,60.71
  Bottom 0.127: v90.04,13.97 90.04,16.26 90.81,17.02 90.81,34.16 85.98,38.99 v85.98,40.89 | v83.95,42.16 83.95,48.64 80.26,52.32 80.26,53.09 v82.04,54.86 | v81.53,60.71 81.53,62.23 82.91,63.61 82.91,64.92 81.37,66.46 v81.37,66.48
18-SERVO2  (via drill 0.3)
  Top 0.127: v82.17,61.85 80.64,61.85 80.14,62.36 80.14,62.87 80.52,63.25 81.79,63.25 81.92,63.37 82.68,63.37 82.8,63.5 83.44,63.5 IC9.35 | v81.28,54.99 v81.28,56.64 | v82.55,48.26 83.06,47.75 90.55,47.75 91.69,48.9 91.69,49.78 92.58,50.67 96.14,50.67 97.41,49.4 97.41,47.37 98.55,46.23 101.22,46.23 102.11,47.12 v102.11,48.77 | v89.66,89.15 v97.28,81.53
  Bottom 0.127: v82.17,61.85 82.17,60.33 80.52,58.67 80.52,57.4 v81.28,56.64 | v81.28,54.99 81.28,54.48 80.01,53.21 80.01,50.8 v82.55,48.26 | v102.11,48.77 102.11,52.45 103.63,53.98 103.63,54.48 109.11,59.96 109.11,69.71 v97.28,81.53 | v89.66,89.15 85.47,93.34 JP6.1
19-SERVO1  (via drill 0.3)
  Top 0.127: v82.8,68.45 82.8,70.67 85.6,73.46 85.6,77.72 88.52,80.64 88.52,87.12 82.3,93.34 JP5.1 | v82.93,61.72 83.27,61.38 84.37,61.38 84.62,61.63 IC9.38
  Bottom 0.127: v82.93,61.72 82.93,63.25 83.17,63.48 83.17,68.09 v82.8,68.45
21-SDA  (via drill 0.3)
  Top 0.127: IC9.42 86.22,60.93 85.71,60.41 v85.71,60.35 | R9.1 65.44,66.51 65.72,66.78 IC5.23 65.72,69.3 65.58,69.44 65,69.44 63.12,67.56 61.47,67.56 59.31,65.41 v58.29,65.41 | IC11.24 55.2,63.08 55.87,63.75 v56.64,63.75 | v84.33,56.77 84.33,55.8 84.69,55.44 86.51,55.44 86.87,55.08 86.87,54.61 | 86.87,54.61 86.87,53.47 86.61,53.21 81.41,53.21 81.15,53.47 70.87,53.47 68.33,50.93 62.74,50.93 62.61,50.8 v60.96,50.8 | v107.19,43.31 107.19,48.77 106.81,49.15 106.81,55.12 | v106.81,56.77 106.81,55.12 | v87,54.61 86.87,54.61 | v92.84,61.34 93.34,61.34 93.85,61.85 95.01,61.85 96.74,60.12 100.71,60.12 101.6,59.23 101.6,58.06 100.34,56.8 100.34,55.81 102.25,53.9 103.43,53.9 104.65,55.12 106.81,55.12 | v72.01,4.95 70.75,6.21 61.77,6.21 58.83,3.27 47.99,3.27 47.5,3.76 v47.5,4.95
  Bottom 0.127: v58.29,65.41 v56.64,63.75 54.99,65.41 51.44,65.41 50.42,64.39 50.42,57.78 53.85,54.36 57.4,54.36 v60.96,50.8 | v84.33,56.77 85.6,58.04 85.6,60.33 v85.71,60.35 | 109.51,36.45 109.47,36.45 109.47,28.57 92.2,11.3 87.12,11.3 82.3,6.48 82.3,4.57 81.66,3.94 75.95,3.94 74.93,4.95 v72.01,4.95 | 109.51,36.45 110.49,36.45 JP1.4 | 109.51,36.45 108.32,37.65 107.19,37.65 106.93,37.9 106.93,43.05 v107.19,43.31 | v106.81,56.77 106.81,57.28 109.47,59.94 109.47,63.12 110.62,64.26 JP11.4 | 46.23,7.62 DSP1.D11 46.15,4.96 46.14,4.95 | v87,54.61 89.92,54.61 92.84,57.53 v92.84,61.34 | DSP1.D12 45.45,5.12 45.61,4.95 46.14,4.95 | 46.14,4.95 v47.5,4.95
22-SCL  (via drill 0.3)
  Top 0.127: IC9.39 85.02,61.62 84.84,61.45 84.84,61.28 84.4,60.84 84.4,60.52 84.23,60.35 v84.23,60.07 84.2,60.07 83.06,60.07 81.53,61.59 80.9,61.59 | 66.36,66.93 IC5.22 | IC11.23 55.7,62.75 55.82,62.87 v56.64,62.87 | v61.09,64.64 62.74,64.64 63.5,65.41 R11.1 64.2,65.48 64.89,66.17 65.64,66.17 66.36,66.89 66.36,66.92 66.81,66.47 68.48,66.47 v69.27,65.67 | 80.9,61.59 79.63,61.59 79.5,61.47 78.99,61.47 78.49,61.98 78.49,62.87 78.23,63.12 75.06,63.12 74.55,63.63 v74.55,65.41 | v63.63,27.56 64.23,28.16 74.37,28.16 75.22,27.3 79.25,27.3 | 79.25,27.3 85.34,27.3 88.27,24.38 100.58,24.38 106.93,30.73 106.93,36.83 107.95,37.85 109.47,37.85 110.49,38.86 JP1.2 | v109.47,52.32 109.47,64.77 110.62,65.91 110.62,66.8 JP11.2 | 80.9,61.59 80.9,59.56 81.79,58.67 81.79,58.04 80.52,56.77 v80.52,54.86 | 79.25,27.3 v79.25,34.67
  Bottom 0.127: v56.64,62.87 59.31,62.87 v61.09,64.64 | v74.55,65.41 71.88,65.41 71.63,65.15 69.79,65.15 v69.27,65.67 | v63.63,27.56 62.99,28.19 54.8,28.19 44.75,18.14 DSP1.D13 | v109.47,52.32 109.47,48.64 110.49,47.62 111,47.62 111.76,46.86 111.76,43.33 109.63,41.19 109.63,39.85 110.49,38.99 JP1.2 | v80.52,54.86 80.52,54.1 79.76,53.34 79.76,50.55 80.9,49.4 80.9,45.09 79.25,43.43 v79.25,34.67
23-PWMA  (via drill 0.3)
  Top 0.127: IC9.36 82.33,63.09 81.83,62.59 v80.73,62.59 | v53.59,76.96 55.88,76.96 IC10.23 | v52.45,76.2 52.45,75.29 50.8,73.64 v50.8,69.47 | v56.77,50.67 59.18,50.67 60.58,52.07 v68.58,52.07 | v73.67,55.67 74.02,56.02 78.37,56.02 79.76,57.4 v79.76,60.2
  Bottom 0.127: v53.59,76.96 52.83,76.2 v52.45,76.2 | v50.8,69.47 49.15,67.82 49.15,58.29 v56.77,50.67 | v68.58,52.07 70.07,52.07 v73.67,55.67 | v79.76,60.2 79.25,60.71 79.25,61.21 80.64,62.61 v80.73,62.59
25-PWMB  (via drill 0.3)
  Top 0.127: IC9.14 88.22,68.92 89.26,69.96 89.26,70.41 88.25,71.42 v87.47,71.42 | v81.43,72.59 79.8,70.96 71.77,70.96 70.5,69.69 68.12,69.69 67.92,69.89 v66.94,69.89 | v58.63,81.92 57.41,81.92 57.16,82.17 IC10.15
  Bottom 0.127: v87.47,71.42 86.85,71.42 85.97,72.3 81.72,72.3 v81.43,72.59 | v66.94,69.89 66.04,69.89 65.13,70.8 65.13,71.6 65.19,71.66 65.19,72.74 64.74,73.19 62.19,73.19 60.29,75.09 60.29,76.18 60.36,76.25 60.36,80.19 v58.63,81.92
26-BUZZER  (via drill 0.3)
  Top 0.127: v88.72,70.19 88.43,69.89 88.43,69.68 87.82,69.07 IC9.15 | v86.23,73.91 88.77,76.45 88.77,87.5 86.74,89.53 86.74,98.81 85.85,99.69 79.71,99.69 78.34,98.33 78.34,93.22 81.48,90.07 81.48,88.3 81.16,87.98 79.72,87.98 78.87,87.12 78.87,84.84 R39.1
  Bottom 0.127: v86.23,73.91 86.23,72.9 87.17,71.97 87.69,71.97 88.01,71.65 88.01,71.12 88.65,70.48 88.65,70.23 v88.72,70.19
27-SHCP  (via drill 0.3)
  Top 0.127: IC9.16 87.42,69.03 87.88,69.5 v87.88,69.95 | IC15.11 76.64,79.43 | v74.55,79.12 74.21,79.12 73.94,78.86 71.19,78.86 70.78,79.27 IC13.11 | v75.95,78.74 76.64,79.43 | v78.49,78.23 78.37,78.23 77.95,78.65 77.42,78.65 76.64,79.43
  Bottom 0.127: v78.49,78.23 80.26,76.45 80.26,72.99 81.21,72.04 85.87,72.04 87,70.92 87,70.57 87.58,69.98 87.85,69.98 v87.88,69.95 | v74.55,79.12 75.56,79.12 v75.95,78.74
32-STCP  (via drill 0.3)
  Top 0.127: v89.28,68.71 89.36,68.63 IC9.12 | v75.56,82.93 75.56,82.68 75.99,82.26 IC15.12 75.99,79.56 74.91,78.49 70.61,78.49 70.13,78.96 IC13.12
  Bottom 0.127: v89.28,68.71 89.28,71.37 86.87,73.79 86.87,74.17 79.5,81.53 76.96,81.53 v75.56,82.93
33-DS  (via drill 0.3)
  Top 0.127: IC9.13 88.62,68.89 89.44,69.71 v89.89,69.71 | v68.96,82.3 68.84,82.18 IC13.14 | v69.47,84.58 70.99,84.58 72.39,85.98 73.66,85.98 v74.3,85.34
  Bottom 0.127: v68.96,82.3 68.96,82.34 69.47,82.84 v69.47,84.58 | v74.3,85.34 74.3,85.09 76.2,83.19 76.2,82.8 77.22,81.79 79.63,81.79 88.52,72.9 88.52,72.52 89.79,71.25 89.79,69.72 v89.89,69.71
34-ENC_B  (via drill 0.3)
  Top 0.127: C46.1 R42.2 66.93,20.83 v66.93,19.94 | IC9.10 90.75,66.69 v90.87,66.81 | v84.71,40.89 83.44,40.89 79.88,44.45 v62.87,44.45 | v51.56,33.02 52.07,33.02 63.37,21.72 v65.02,21.72
  Bottom 0.127: 66.93,19.81 66.93,18.16 66.8,18.03 66.8,4.19 67.94,3.05 RE1.B1 | v84.71,40.89 85.6,41.78 87.51,41.78 93,47.27 93,47.6 95.92,50.52 95.92,61.76 v90.87,66.81 | v62.87,44.45 51.56,33.15 v51.56,33.02 | 66.93,19.81 v65.02,21.72 | 66.93,19.81 v66.93,19.94
35-ENC_A  (via drill 0.3)
  Top 0.127: R41.2 67.53,21.94 | 67.53,21.94 C45.1 | IC9.11 90.19,67.09 90.65,67.55 v91,67.55 | v67.44,22.86 67.53,22.77 67.53,21.94 | v81.53,51.94 70.1,51.94 63.88,45.72 v63.5,45.72 | v67.06,24.13 67.97,25.05 72.42,25.05 v73.03,25.65
  Bottom 0.127: 67.06,22.86 65.28,22.86 64.39,21.97 64.39,20.95 66.29,19.05 66.29,6.35 62.99,3.05 RE1.A1 | 67.06,22.86 v67.44,22.86 | v63.5,45.72 63.5,44.83 73.03,35.31 v73.03,25.65 | 67.06,22.86 v67.06,24.13 | v91,67.55 90.89,67.44 90.73,67.44 90.33,67.03 90.33,66.58 91.12,65.79 91.14,65.79 94.65,62.28 94.65,58.6 87.99,51.94 v81.53,51.94
36-VBAT  (via drill 0.3)
  Top 0.127: R74.1 40.27,58.14 R72.2 40.27,57.27 v40.39,57.15 | IC9.5 91.18,64.69 91.94,65.45 93.15,65.45 C24.1 96.12,65.96 97.18,64.9 98.29,64.9 100.39,62.8 104.23,62.8 107.44,59.59 v107.44,49.4 | v62.74,36.45 v54.99,44.2 | v72.14,24.38 86.74,24.38 88.14,22.99 101.55,22.99 108.84,30.28 v108.84,31.5
  Bottom 0.127: v40.39,57.15 42.04,57.15 v54.99,44.2 | v62.74,36.45 62.74,33.78 v72.14,24.38 | v108.84,31.5 105.66,34.67 105.66,47.62 v107.44,49.4
39-VOUT  (via drill 0.3)
  Top 0.127: C25.1 92.63,67.02 92.25,67.02 91.12,65.89 IC9.8 | v40.12,95.31 40,95.43 37.75,95.43 IC8.1 | v59.69,95.89 60.45,95.89 61.21,95.12 63.75,95.12 v64.39,94.49 | v89.66,75.31 v89.66,82.8 | v90.68,69.72 90.68,69.11 92.74,67.04 92.5,66.97
  Bottom 0.127: v40.12,95.31 44.37,95.31 44.82,95.76 50.16,95.76 51.05,96.65 58.93,96.65 v59.69,95.89 | v64.39,94.49 65.02,95.12 65.02,95.13 65.43,95.54 70.35,95.54 73.52,92.37 83.72,92.37 87.25,88.84 87.25,85.22 v89.66,82.8 | v89.66,75.31 89.66,73.28 90.68,72.26 v90.68,69.72
+1S  (via drill 0.3)
  Top 0.127: Q14.S 17.54,41.3 16.64,40.4 13.33,40.4 13.05,40.68 IC16.3 11.33,41.3 C54.2 | C54.2 | R56.1 9.04,37.89 8.72,38.21 8.72,39.56 C54.2 | R77.2 17.21,72.95 16.51,72.25 16.51,69.09 18.41,67.18 v18.41,63.63 | 22.8,42.73 v26.29,46.23
  Top 0.254: R62.2 24.98,28.36 24.3,29.04 24.3,38.63 J3.1S 22.8,42.73 22.19,43.34 19.3,43.34 19.11,43.15 19.11,41.5 18.91,41.3 Q14.S
  Bottom 0.127: v18.41,63.63 18.41,55.12 23.11,50.42 23.11,47.62 24.51,46.23 v26.29,46.23
+3V3  (via drill 0.3)
  Top 0.127: R17.1 R20.2 R16.1 R19.2 65.96,58.8 FL2.1 65.24,59.56 66.36,60.69 IC5.3 66.37,62.25 66.37,63.4 65.94,63.84 61.01,63.84 60.45,64.39 60.45,64.9 | IC13.16 67.53,82.85 C49.1 67.53,82.89 70.07,82.89 71.63,84.45 v72.14,84.45 75.21,84.45 77.29,82.38 IC15.10 77.28,79.42 77.65,79.05 78.44,79.05 79.03,78.46 79.03,78.01 78.71,77.69 78.14,77.69 v77.72,78.11 | C53.1 73.36,80.89 IC15.16 72.87,80.87 72.64,80.66 v72.64,79.76 72.37,79.49 71.69,79.49 71.44,79.74 IC13.10 | C31.2 C28.1 | IC8.24 C28.1 | C16.2 C20.2 94.61,58.93 94.11,59.44 92.2,59.44 | IC9.19 86.23,69.73 86.44,69.94 86.44,70.43 86.43,70.44 v86.43,70.72 86.67,70.96 86.67,71.75 87.94,73.03 97.54,73.03 | IC9.37 84.16,62.28 v83.61,62.28 | IC9.43 86.62,60.52 v86.44,60.35 | IC9.46 87.82,60.6 88.37,60.05 v88.37,60.04 | IC9.1 89.37,61.84 v89.52,61.69 89.97,61.69 92.21,59.45 92.2,59.44 | IC9.4 91.31,64.29 | C18.2 91.92,64.9 91.31,64.29 | IC9.3 90.91,63.89 91.17,64.15 | 91.17,64.15 91.31,64.29 | 108.84,42.29 110.49,43.94 JP4.6 | 108.84,42.29 100.46,33.91 99.95,33.91 FL1.1 | 108.84,42.29 111.63,39.5 111.63,35.94 110.62,34.92 110.62,33.91 JP1.6 110.49,33.78 110.49,31.35 101.88,22.73 95.63,22.73 91.44,18.54 | 91.44,18.54 91.57,18.54 104.19,5.92 104.19,3.81 104.57,3.43 RGB2.+5V | 91.44,18.54 84.84,18.54 84.55,18.26 81.99,18.26 R8.1 R10.2 81.97,16.54 81.65,16.22 79.03,16.22 v78.61,16.64 | 64.39,18.93 62.99,17.53 RE1.1 | 64.39,18.93 65.91,20.45 65.91,20.83 R42.1 R41.1 66.01,21.95 66.01,22.75 66.75,23.5 v71.37,23.5 | 38.1,22.86 37.59,23.37 C42.1 37.59,23.5 38.61,24.51 58.81,24.51 64.39,18.93 | 38.1,22.86 40.12,22.86 40.62,23.36 R32.2
  Top 0.127: 38.1,22.86 38.1,21.59 v34.04,17.53 20.46,3.95 18.04,3.95 15.24,1.14 2.4,1.14 1.81,1.73 1.81,3.11 2.14,3.44 RGB1.+5V 2.78,3.44 1.91,4.32 1.91,40.4 3.61,42.11 3.61,55.45 2.41,56.64 JP2.6 | IC5.24 65.02,68.07 64.14,68.07 62.61,66.55 R9.2 R11.2 62.48,65.41 60.96,65.41 60.45,64.9 | 53.34,78.96 52.23,78.96 v51.95,79.25 v51.94,79.25 | v60.83,75.31 59.94,75.31 v58.04,77.22 58.04,77.4 57.62,77.81 57.62,78.45 57.17,78.91 55.93,78.91 IC10.20 54.52,78.91 v54.46,78.97 53.34,78.97 53.34,78.96 | v59.69,64.9 60.45,64.9 | v56.39,75.56 v56.39,72.01 | 53.34,78.96 C32.1 | v22.86,82.04 v26.8,78.11 | 92.2,59.44 91.69,58.93 C19.2 | v91.19,64.14 91.17,64.15 | 97.92,68.71 101.22,68.71 108.08,61.85 JP11.5 | 97.92,68.71 93.22,68.71 92.71,68.2 C17.2 | 97.54,73.03 97.92,72.64 97.92,68.71 | v87.88,86.87 86.49,86.87 85.72,86.11 83.25,86.11 C44.1 81.83,84.71 81.19,84.07 78.49,84.07 77.59,84.97 D4.1 75.94,87 75.56,87.38 75.3,87.38 74.68,88 v74.68,88.39 | JP3.6 62.87,98.42 64.64,96.65 65.15,96.65 LS1.P 69.85,91.95 69.85,90.17 v72.14,87.88 | v47.5,96.39 47.46,96.35 C28.1 | 97.54,73.03 97.54,80.39 99.69,82.55 v99.69,84.45
  Bottom 0.127: TP2.1 34.04,30.1 v34.04,17.53 34.04,12.54 34.86,11.72 | 36.32,7.75 DSP1.D25 36.34,10.23 34.86,11.72 | v78.61,16.64 77.72,16.64 74.68,19.68 74.68,20.19 v71.37,23.5 | v54.46,78.97 54.69,78.74 56.39,78.74 Q3.2 | v60.83,75.31 60.83,77.53 62.04,78.74 67.94,78.74 Q2.2 | v59.69,64.9 56.39,68.2 v56.39,72.01 | v58.04,77.22 v56.39,75.56 | v51.94,79.25 52.07,79.38 52.07,80.52 51.56,81.03 49.02,81.03 46.74,78.74 45.09,78.74 Q4.2 44.96,78.74 42.29,78.74 Q5.2 40.1,78.77 37.72,81.15 36.84,81.15 36.08,80.39 35.31,80.39 U2.1 35.21,80.98 35.06,81.13 32.45,81.13 31.11,79.8 31.11,77.98 30.73,77.6 27.3,77.6 v26.8,78.11 | 10.5,85.05 12.83,87.38 13.08,87.38 Q6.2 13.21,87.38 19.72,87.38 21.76,85.34 Q9.2 21.84,83.57 22.86,82.55 v22.86,82.04 | 10.5,85.05 1.27,75.82 1.27,61.47 2.29,60.45 JP2.6 | 84.2,62.23 85.34,62.23 86.36,61.21 86.36,60.71 | 84.2,62.23 83.69,62.23 v83.61,62.28 | 86.36,60.71 86.36,60.45 v86.44,60.35 | 84.2,62.23 84.2,70.48 84.58,70.87 86.11,70.87 86.23,70.74 86.36,70.74 v86.43,70.72 | v91.19,64.14 91.19,62.48 90.42,61.72 89.53,61.72 v89.52,61.69 89.41,61.59 89.41,61.09 88.39,60.07 v88.37,60.04 88.27,60.15 88.27,60.16 87.72,60.71 86.36,60.71 | 99.69,87.38 90.42,87.38 89.92,86.87 v87.88,86.87 | Q1.2 70.79,78.74 72.33,78.74 72.64,79.06 v72.64,79.76 72.64,81.15 72.14,81.66 v72.14,84.45 72.14,87.25 | v77.72,78.11 77.69,78.14 77.69,79.11 U3.1 | JP3.6 62.74,98.42 61.72,97.41 51.44,97.41 50.04,96.01 47.88,96.01 v47.5,96.39 46.74,97.16 29.08,97.16 28.45,97.79 19.68,97.79 9.76,87.86 9.76,85.79 10.5,85.05 | v72.14,87.88 72.14,87.25 | v74.68,88.39 74.42,88.39 73.28,87.25 72.14,87.25
  Bottom 0.127: 99.69,87.38 v99.69,84.45 | 99.69,87.38 Q8.2 | DSP1.D22 38.45,10.76 37.48,11.72 34.86,11.72
+5V  (via drill 0.3)
  Top 0.127: R65.1 R63.1 63.09,90.53 | 63.09,90.53 63.09,90.55 | 63.09,90.55 R60.1 R23.1 R26.1 R57.1 R58.1 R59.1 | R68.1 99.31,45.21 v100.2,45.21 101.6,45.21 v102.36,45.97 | R7.1 74.05,5.88 74.55,6.38 74.55,8.26 v74.42,8.38 | v74.42,13.46 74.42,14.03 74.03,14.42 C14.2 C12.2 75.04,15.53 75.66,16.14 75.66,17.38 IC4.7 | 63.09,90.55 60.96,90.55 v60.83,90.68 | 63.07,90.53 63.09,90.53 | v60.2,72.01 60.25,72 | IC3.4 52.45,71.12 59.05,71.12 IC3.2 | v75.82,13.46 76.45,13.46 77.34,14.35 78.36,14.35 D3.1 | v98.04,35.43 94.44,35.43 93.34,34.34 93.34,32.68
  Top 0.254: IC3.2 59.34,71.09 60.25,72 C6.1 C9.1 v61.7,69.25 | v90.25,32.65 90.28,32.68 IC2.3 93.34,32.68 93.37,32.68 93.68,32.37 C1.1 | Q17.2 62.32,54.17 v61.7,53.55 | D3.1 78.66,14.43 79.95,15.72 83.65,15.72 v84.21,15.16
  Bottom 0.127: v100.2,45.21 100.2,50.67 97.44,53.43 97.44,58.1 99.38,60.04 99.38,64.18 100.35,65.15 107.28,65.15 JP11.3 | v74.42,8.38 v74.42,13.46 v75.82,13.46 | TP1.1 32.75,28.82 31.62,29.95 31.62,31.88 32.38,32.64 45.85,32.64 51.06,37.85 51.06,38.52 51.38,38.83 52.04,38.83 61.59,48.39 61.7,48.45 | v60.83,90.68 60.83,89.66 60.11,88.94 60.11,84.17 58.09,82.14 58.09,81.62 58.34,81.38 58.56,81.38 60.11,79.83 60.11,76.36 59.91,76.16 59.91,72.3 v60.2,72.01 | v102.36,45.97 98.04,41.66 v98.04,35.43
  Bottom 0.254: v61.7,69.25 v61.7,53.55 61.7,48.45 77.5,32.65 v90.25,32.65 90.25,17 88.41,15.16 v84.21,15.16
+BAT_2S  (via drill 0.3)
  Top 0.127: 6.1,43.94 5.08,44.96 5.08,51.53 5.7,52.15 R47.1 | 6.1,43.94 8.29,41.75 9.79,41.75 R55.1 | v17.14,70.87 17.14,71.57 17.45,71.87 R76.1 | v13.15,48.99 13.24,48.9 Q11.3 | IC18.3 98.23,48.13 v98.21,48.11 | v97.79,46.1 97.79,45.59 97.66,45.47 97.66,43.69 98.17,43.18 v100.46,43.18 | v100.46,38.23 100.17,38.52 99.4,38.52 99.22,38.34 D6.1 | v6.1,44.07 6.1,43.94 | v7.49,45.47 7.49,45.49
  Top 0.254: R61.2 26.79,41.28 J3.2S | v46.7,44.2 50.99,39.91 50.99,38.04 53.7,35.33 78.69,35.33 78.89,35.53 79.61,35.53 79.72,35.41 86.17,35.41 C61.1 C58.1 C57.1 87.81,38.83 89.24,40.26 89.24,41.02 89.6,41.38 90.1,41.38 90.28,41.2 92.7,41.2 97.07,36.83 D6.1
  Top 0.61: J2.B+ 19.45,48.9 Q11.3 Q11.2 Q11.1 14.51,46.35 13.64,45.49 7.49,45.49 JP8.1
  Bottom 0.127: v17.14,70.87 17.14,69.6 14.22,66.67 14.22,62.1 12.83,60.71 12.83,49.31 v13.15,48.99 | v98.21,48.11 98.21,46.52 v97.79,46.1 | v100.46,38.23 v100.46,43.18 | v7.49,45.47 v6.1,44.07
  Bottom 0.254: v46.7,44.2 38.56,44.2 37.81,44.94 35.72,44.94 33.6,42.82 25.95,42.82 J3.2S 25.6,42.74 J2.B+
+J5V  (via drill 0.3)
  Top 0.127: v34.29,41.4 36.45,41.4 36.58,41.27 44.58,41.27 44.7,41.4 | 44.63,55.5 24.64,55.5 24.51,55.63 24.51,57.02 24.64,57.15 27.83,57.15 28.44,57.76 28.44,61.74 27.53,62.65 25.06,62.65 23.93,61.52 23.93,60.08 24.29,59.72 IC1.4
  Top 0.305: C8.1 49.72,67.47 v49.75,67.5
  Top 0.406: L1.2 47,67.18 C8.1 47.29,62.32 45.53,60.56 C5.1 44.63,55.5 44.63,41.47 44.7,41.4 61.75,24.35 65.3,24.35 67.1,26.15 71.7,26.15 72.4,26.85 84.85,26.85 88.2,23.5 101.3,23.5 108.03,30.23 JP1.5 JP1.3
  Bottom 0.127: v34.29,41.4 32.89,41.4 TP12.1
  Bottom 0.305: v49.75,67.5 55.02,72.77 57.96,72.77 58.8,73.6 58.8,80.65 58.42,81.03 58.09,81.03 57.74,81.38 57.74,82.29 58.85,83.39 58.85,89.84 65.01,96 JP5.2 JP6.2
A1  (via drill 0.3)
  Top 0.254: v57.93,86.54 60.24,84.23 64.41,84.23 65.25,83.39 65.25,80.06 64.62,79.43 64.62,77.17 | 64.62,77.17 64.42,76.97 IC10.2 | IC10.1 64.47,76.31 64.62,76.47 64.62,77.17
  Bottom 0.254: v57.93,86.54 57.74,86.35 29.6,86.35 28.54,87.41 M2.1 27.37,87.41 26.35,86.39 26.35,79.27 20.3,73.22 17.76,73.22 13.51,68.97 13.51,64.25 12.02,62.76 12.02,36.32 18.3,30.04 18.3,15.39 20.7,12.99 26.29,12.99 26.98,12.29 27.88,12.29 28.51,12.92 28.51,19.89 M1.1
A2  (via drill 0.3)
  Top 0.254: v58.14,85.43 60.03,83.54 60.03,79.69 60.16,79.56 | 60.16,79.56 IC10.6 | IC10.5 60.8,78.92 60.16,79.56
  Bottom 0.254: v58.14,85.43 57.6,85.97 29.6,85.97 27.43,83.8 M2.2 20.46,72.84 17.92,72.84 13.89,68.81 13.89,64.09 12.4,62.6 12.4,36.48 18.68,30.2 18.68,15.55 20.86,13.37 M1.2
AE1
  Top 0.127: IC8.23 44.82,94.79 43.17,94.79 41.4,93.02 41.4,90.04 35.69,84.33 27.94,84.33 27.18,83.57 13.46,83.57 3.81,73.91 3.81,65.41 4.83,64.39 JP12.4
AE2  (via drill 0.3)
  Top 0.127: IC8.22 44.84,94.15 46.53,94.15 46.99,93.69 49.62,93.69 50.04,94.11 50.04,95.76 48.13,97.66 v47.12,97.66 | v3.56,82.04 3.56,63.12 4.83,61.85 JP12.6
  Bottom 0.127: v47.12,97.66 28.96,97.66 28.57,98.04 19.56,98.04 v3.56,82.04
AIN1  (via drill 0.3)
  Top 0.127: v69.6,71.12 72.75,74.28 72.75,77.01 72.25,77.51 70.16,77.51 68.2,79.48 68.2,80.77 IC13.15 | v65.68,71.02 64.82,71.02 63.53,69.74 62.85,69.74 62.48,70.1 62.48,73.93 62.18,74.23 57.85,74.23 57.49,74.59 57.49,77.57 56.83,78.23 56.01,78.23 IC10.21
  Bottom 0.127: v69.6,71.12 69.59,71.11 65.77,71.11 v65.68,71.02
AIN2  (via drill 0.3)
  Top 0.127: v57.15,72.01 57.15,77.43 56.98,77.6 56.01,77.6 IC10.22 | v64.64,71.88 65.17,71.88 65.76,72.47 65.76,73.17 65.97,73.38 67.45,73.38 67.55,73.48 67.55,74.99 IC13.1
  Bottom 0.127: v64.64,71.88 61.34,71.88 59.69,70.23 59.69,66.55 59.31,66.17 58.8,66.17 57.15,67.82 v57.15,72.01
B1  (via drill 0.3)
  Top 0.254: IC10.11 64.31,82.81 v64.63,83.14 64.31,83.47 IC10.12
  Bottom 0.254: v64.63,83.14 64.52,83.25 64.52,85.74 69.28,90.5 82.37,90.5 M3.2 85.47,86.42 85.85,86.03 85.85,81.31 86.98,80.18 88.07,80.18 97.13,71.13 97.13,50.02 96.97,49.86 96.97,19.5 89.75,12.28 85.02,12.28 83.6,13.7 83.6,19.09 M4.2
B2  (via drill 0.3)
  Top 0.254: IC10.7 64.3,80.22 v64.61,80.53 64.28,80.86 IC10.8
  Bottom 0.254: v64.61,80.53 65.24,81.16 65.24,83.39 64.9,83.73 64.9,85.58 69.44,90.12 82.21,90.12 84.04,88.29 84.04,87.31 85.47,85.88 M3.1 87.92,79.8 96.75,70.97 96.75,50.18 96.59,50.02 96.59,19.66 90.29,13.36 M4.1
B-  (via drill 0.3)
  Top 0.127: Q15.S 17.52,37.45 16.54,36.47 13.29,36.47 13.05,36.71 IC17.3 11.33,37.45 C55.2 | C60.2 C59.2 24.56,76.5 23.01,74.95 23.01,68.35 v21.97,67.31 | IC19.6 26.67,65.91 26.29,65.91 25.4,65.02 25.4,63.63 24.77,62.99 19.05,62.99 18.8,62.74 15.24,62.74 13.92,64.06 13.92,65.33 13.99,65.41 Q18.3 | J3.GND 25.34,37.2 25.34,30.32 28.24,30.32 28.48,30.56 28.48,45.18 25.27,48.39 J2.GND
  Top 0.254: Q15.S 18.62,37.45 19.04,37.87 19.04,39.05 20.01,40.02 21.32,40.02 v21.6,40.3
  Top 0.61: v17.2,66.65 15.4,66.65 | 15.4,66.65 Q18.2 Q18.3 | 15.4,66.65 15.4,67.92 Q18.1 9.34,67.94 6.52,70.76 JP10.2
  Bottom 0.127: 19.26,64.59 v21.97,67.31
  Bottom 0.254: v21.6,40.3 21.6,39.1 23.31,37.39 J3.GND
  Bottom 0.61: J2.GND 25.27,58.58 19.26,64.59 v17.2,66.65
BIN1  (via drill 0.3)
  Top 0.127: v68.83,72.64 68.2,73.28 68.2,74.93 IC13.2 | v73.53,72.64 74.04,72.64 74.68,72.01 77.72,72.01 80.14,74.42 80.14,75.69 83.95,79.5 v83.95,82.17 | v76.83,86.23 76.33,86.23 75.44,87.12 75.18,87.12 71.25,91.05 71.25,93.2 64.91,99.53 62.02,99.53 61.56,99.07 61.56,97.62 60.71,96.77 54.61,96.77 v53.85,96.01 | v52.58,95.5 50.16,93.09 50.16,87.12 53.98,83.31 53.98,81.13 54.24,80.87 IC10.17
  Bottom 0.127: v73.53,72.64 v68.83,72.64 | v83.95,82.17 83.95,82.55 81.03,85.47 77.6,85.47 v76.83,86.23 | v53.85,96.01 53.09,96.01 v52.58,95.5
BIN2  (via drill 0.3)
  Top 0.127: v59.05,66.8 60.33,68.07 62.61,68.07 64.64,70.1 66.03,70.1 66.61,70.69 67.77,70.69 69.47,72.39 69.47,72.93 68.84,73.56 IC13.3 | v58.17,78.05 58.17,77.97 v59.55,76.58 v59.56,76.58 | v58.17,80.39 58.17,80.58 57.24,81.51 55.93,81.51 IC10.16
  Bottom 0.127: v59.05,66.8 59.05,73.28 59.56,73.79 v59.56,76.58 | v58.17,80.39 v58.17,78.05
CP3V3  (via drill 0.3)
  Top 0.127: C13.2 71.18,20.79 R3.1 | C11.2 C13.2 | IC4.5 73.41,18.58 | C13.2 71.99,20.85 v72.14,20.7 72.09,20.66 72.09,19.64 73.15,18.58 73.41,18.58 | IC4.6 73.9,18.09 73.41,18.58
  Bottom 0.127: v72.14,20.7 61.18,31.66 49.96,31.66 48.55,30.26 48.1,30.26 46.1,32.26 32.41,32.26 31.88,31.73 31.88,30.61 32.69,29.8 33.19,29.8 33.68,29.31 33.68,26.52 32.58,25.42 30.46,25.42 29.42,26.46 29.42,30.03 32.28,32.89 34.46,32.89 TP7.1
CSN
  Top 0.127: R69.2 84.33,43.18 81.92,45.6 81.92,48.51 85.98,52.58 87.88,52.58 90.55,55.24 92.84,55.24 92.96,55.12 92.96,53.34 94.49,51.82 102.49,51.82 103.63,50.67 105.16,50.67 IC18.8
  Top 0.254: R69.2 87.51,43.18 88.8,44.47 L4.1
D+  (via drill 0.3)
  Top 0.127: U1.A6 80.5,7.02 80.5,6.33 80.66,6.18 81.03,6.18 | 81.03,6.18 81.38,6.18 81.54,6.33 81.54,7.04 81.52,7.02 U1.B6 | v77.09,13.21 77.08,13.21 75.56,11.69 D2.3 | IC4.3 74.08,19.59 73.77,19.9 v73.77,20.02 73.77,20.34 71.25,22.86 v68.71,22.86 | v81.03,5.97 81.03,6.18 | 81.03,6.22 81.03,6.18
  Bottom 0.127: v73.77,20.02 73.98,20.02 77.09,16.91 v77.09,13.21 78.87,13.21 81.53,10.54 81.53,9.53 81.03,9.02 v81.03,5.97 | v68.71,22.86 68.71,23.37 63.37,28.7 35.43,28.7 TP5.1
D-  (via drill 0.3)
  Top 0.127: U1.A7 81.02,7.92 80.95,7.98 80.2,7.98 80.02,7.8 U1.B7 80.01,6.99 80.01,5.97 v80.14,5.84 | IC4.4 73.63,19.1 v73.63,19.18 | v76.45,10.92 75.55,10.92 75.42,10.78 75.42,9.94 D2.4
  Bottom 0.127: TP6.1 35.43,31.24 35.54,31.24 37.82,28.96 63.5,28.96 71.5,20.95 71.5,20.45 72.76,19.19 v73.62,19.19 v73.63,19.18 73.63,18.19 76.45,15.37 v76.45,10.92 76.45,10.79 80.14,7.11 v80.14,5.84
DE1  (via drill 0.3)
  Top 0.127: v77.98,73.79 76.12,73.79 75.99,73.92 75.99,74.99 IC15.5 | v77.09,72.77 76.58,72.26 74.8,72.26 73.79,73.28 v72.64,73.28 | v66.42,71.75 66.42,70.92 65.86,70.36 64.52,70.36 62.48,68.33 60.2,68.33 59.31,67.44 v53.09,67.44 | v38.61,37.08 37.59,37.08 27.43,47.24 27.43,49.28 26.16,50.55 24.38,50.55 22.23,48.39 22.23,47.5 18.92,44.2 v9.78,44.2
  Bottom 0.127: v77.98,73.79 77.72,73.79 77.09,73.15 v77.09,72.77 | v72.64,73.28 67.94,73.28 v66.42,71.75 | v53.09,67.44 50.16,64.52 50.16,57.68 55.39,52.45 58.81,52.45 59.22,52.04 59.22,46.69 51.62,39.09 51.27,39.09 50.8,38.62 50.8,38.1 49.79,37.08 v38.61,37.08 | v9.78,44.2 9.78,55.01 3.53,61.26 3.53,63.15 2.41,64.26 JP12.3
DE2  (via drill 0.3)
  Top 0.127: v75.9,76.73 76.21,76.73 76.63,76.31 IC15.6 | v64.52,72.64 v66.42,74.55 | v60.45,72.77 60.07,72.77 59.18,71.88 57.91,71.88 57.4,71.37 55.12,71.37 v53.34,73.15 | v48.26,70.1 46.23,70.1 45.59,69.47 40.12,69.47 39.68,69.03 39.68,60.65 41.02,59.31 41.02,56.13 40.64,55.75 33.01,55.75 32,56.76 32,72.64 27.3,77.34 9.91,77.34 4.06,71.5 4.06,68.42 4.47,68.02 5.78,68.02 6.08,67.72 6.08,61.04 5.74,60.71 4.08,60.71 3.64,61.15 3.64,62.42 2.99,63.07 1.64,63.07 1.27,63.44 1.27,65.79 2.29,66.8 JP12.1
  Bottom 0.127: v75.9,76.73 75.9,76.15 74.3,74.55 v66.42,74.55 | v64.52,72.64 60.58,72.64 v60.45,72.77 | v53.34,73.15 51.31,73.15 v48.26,70.1
DE3  (via drill 0.3)
  Top 0.127: IC15.7 77.29,76.52 76.47,77.33 74.69,77.33 v74.18,76.82 | v65.53,84.45 v65.52,84.45 65.02,84.96 v61.34,84.96 | v61.34,86.74 60.71,86.74 59.82,87.63 58.8,87.63 58.51,87.92 57.94,87.92 57.28,87.26 v57.28,84.84 | v22.61,62.36 20.78,62.36 20.66,62.48 14.99,62.48 v10.67,66.8